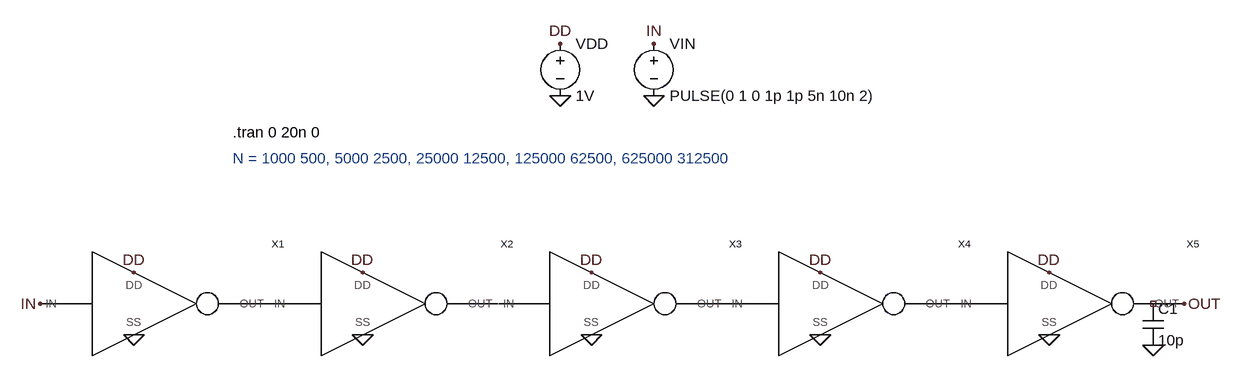
[diagram p0: schematic 3.b.asc]
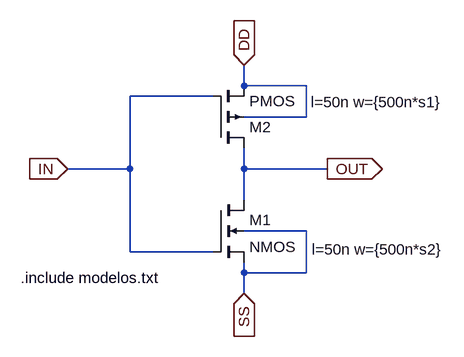
[diagram p1: sub-circuit inversorp3.asc]
3.b.asc, the LTspice schematic file:
Version 4
SHEET 1 1912 680
FLAG 336 -160 0
FLAG 480 -160 0
FLAG 336 -240 DD
FLAG 480 -240 IN
FLAG -464 160 IN
FLAG 1296 160 OUT
FLAG -320 112 DD
FLAG 32 112 DD
FLAG 384 112 DD
FLAG 736 112 DD
FLAG 1088 112 DD
FLAG 1088 208 0
FLAG 736 208 0
FLAG 384 208 0
FLAG 32 208 0
FLAG -320 208 0
FLAG 1248 224 0
SYMBOL voltage 336 -256 R0
SYMATTR InstName VDD
SYMATTR Value 1V
SYMBOL voltage 480 -256 R0
WINDOW 123 0 0 Left 0
WINDOW 39 0 0 Left 0
SYMATTR InstName VIN
SYMATTR Value PULSE(0 1 0 1p 1p 5n 10n 2)
SYMBOL cap 1232 160 R0
SYMATTR InstName C1
SYMATTR Value 10p
SYMBOL inversorp3 -384 160 R0
SYMATTR InstName X1
SYMBOL inversorp3 -32 160 R0
SYMATTR SpiceLine s1=10, s2=5
SYMATTR InstName X2
SYMBOL inversorp3 320 160 R0
SYMATTR SpiceLine s1=50, s2=25
SYMATTR InstName X3
SYMBOL inversorp3 672 160 R0
SYMATTR SpiceLine s1=250, s2=125
SYMATTR InstName X4
SYMBOL inversorp3 1024 160 R0
SYMATTR SpiceLine s1=1250, s2=625
SYMATTR InstName X5
TEXT -168 -104 Left 2 !.tran 0 20n 0
TEXT -168 -64 Left 2 ;N = 1000 500, 5000 2500, 25000 12500, 125000 62500, 625000 312500

inversorp3.asc, the sub-circuit schematic file:
Version 4
SHEET 1 1048 680
WIRE 112 32 112 0
WIRE 208 32 112 32
WIRE 64 48 -64 48
WIRE 208 80 208 32
WIRE 208 80 112 80
WIRE -64 160 -64 48
WIRE -64 160 -160 160
WIRE 112 160 112 128
WIRE 240 160 112 160
WIRE 112 208 112 160
WIRE 208 256 112 256
WIRE -64 288 -64 160
WIRE 64 288 -64 288
WIRE 112 320 112 304
WIRE 208 320 208 256
WIRE 208 320 112 320
WIRE 112 352 112 320
FLAG 112 0 DD
IOPIN 112 0 In
FLAG -160 160 IN
IOPIN -160 160 In
FLAG 240 160 OUT
IOPIN 240 160 Out
FLAG 112 352 SS
IOPIN 112 352 In
SYMBOL nmos4 64 208 R0
WINDOW 123 152 76 Left 2
WINDOW 0 56 31 Left 2
SYMATTR Value2 l=50n w={500n*s2}
SYMATTR InstName M1
SYMBOL pmos4 64 128 M180
WINDOW 123 151 71 Left 2
SYMATTR Value2 l=50n w={500n*s1}
SYMATTR InstName M2
TEXT -232 328 Left 2 !.include modelos.txt

The netlist it stands for:
* 3.b.asc
VDD DD 0 1V
VIN IN 0 PULSE(0 1 0 1p 1p 5n 10n 2)
C1 NC_01 0 10p
XX1 DD 0 IN P001 inversorp3 params: s1=2, s2=1
XX2 DD 0 P001 P002 inversorp3 params: s1=10, s2=5
XX3 DD 0 P002 P003 inversorp3 params: s1=50, s2=25
XX4 DD 0 P003 P004 inversorp3 params: s1=250, s2=125
XX5 DD 0 P004 OUT inversorp3 params: s1=1250, s2=625

* block symbol definitions
.subckt inversorp3 DD SS IN OUT
M1 OUT IN SS SS NMOS l=50n w={500n*s2}
M2 OUT IN DD DD PMOS l=50n w={500n*s1}
.include modelos.txt
.ends inversorp3

.model NMOS NMOS
.model PMOS PMOS
.lib standard.mos
.tran 0 20n 0
* N = 1000 500, 5000 2500, 25000 12500, 125000 62500, 625000 312500
.backanno
.end